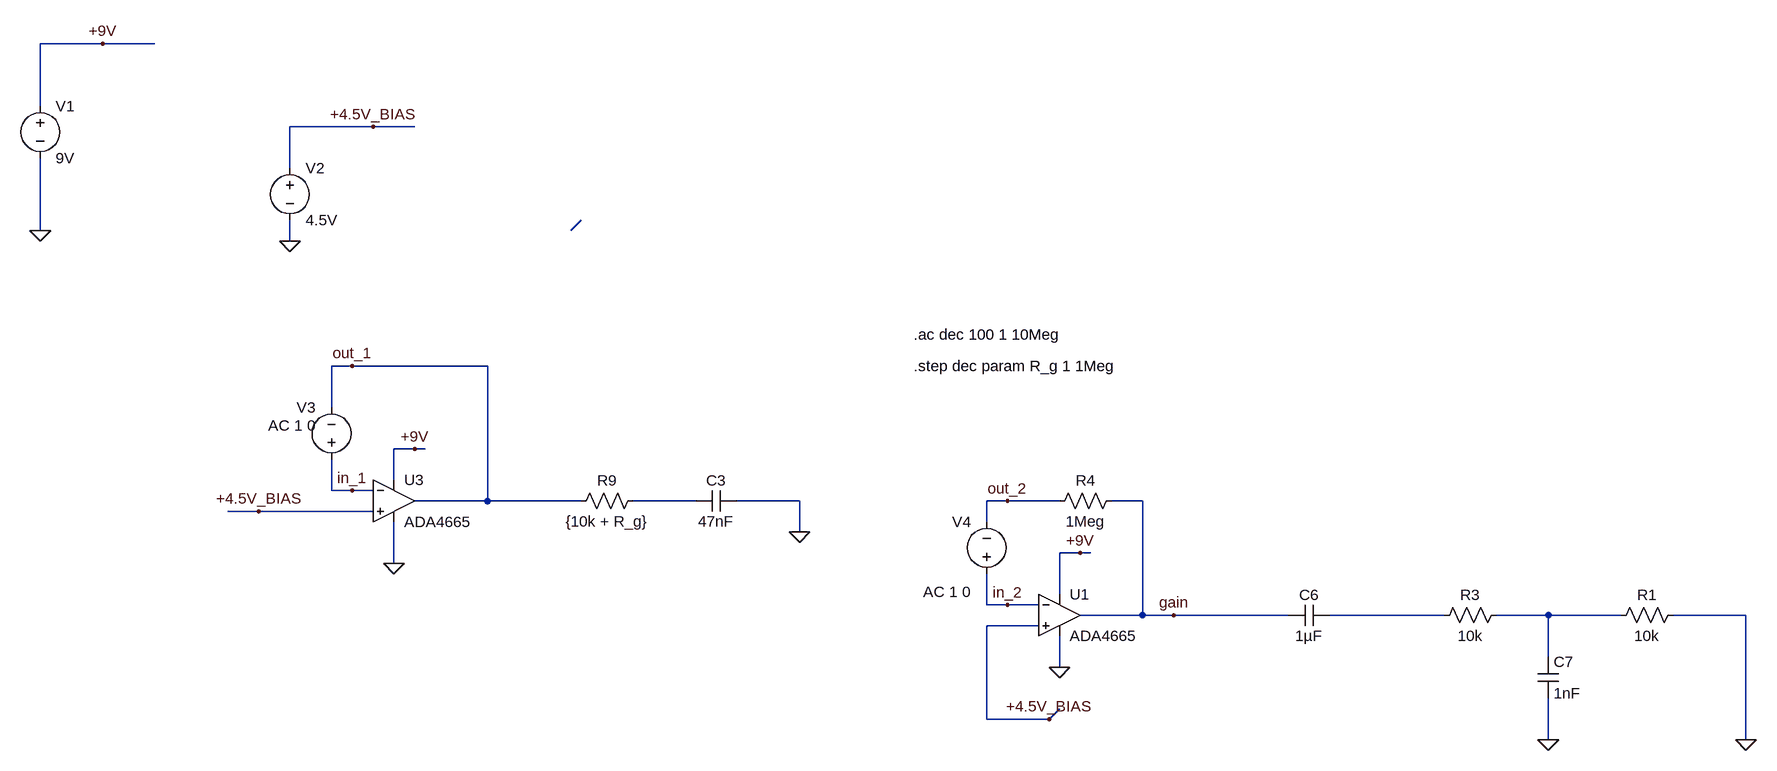
[diagram p0: schematic Distortion_Pedal_Stability_Modded.asc]
Distortion_Pedal_Stability_Modded.asc, the LTspice schematic file:
Version 4.1
SHEET 1 1732 680
WIRE -816 -576 -912 -576
WIRE -736 -576 -816 -576
WIRE -912 -480 -912 -576
WIRE -400 -448 -528 -448
WIRE -336 -448 -400 -448
WIRE -528 -384 -528 -448
WIRE -912 -288 -912 -400
WIRE -96 -288 -80 -304
WIRE -528 -272 -528 -304
WIRE -432 -80 -464 -80
WIRE -224 -80 -432 -80
WIRE -464 -16 -464 -80
WIRE -336 48 -368 48
WIRE -320 48 -336 48
WIRE -368 96 -368 48
WIRE -464 112 -464 64
WIRE -432 112 -464 112
WIRE -400 112 -432 112
WIRE -224 128 -224 -80
WIRE -224 128 -336 128
WIRE -80 128 -224 128
WIRE 96 128 0 128
WIRE 256 128 160 128
WIRE 576 128 544 128
WIRE 656 128 576 128
WIRE 784 128 736 128
WIRE -576 144 -624 144
WIRE -400 144 -576 144
WIRE 544 160 544 128
WIRE 256 176 256 128
WIRE 688 208 656 208
WIRE 704 208 688 208
WIRE -368 224 -368 160
WIRE 656 272 656 208
WIRE 544 288 544 240
WIRE 576 288 544 288
WIRE 624 288 576 288
WIRE 784 304 784 128
WIRE 784 304 688 304
WIRE 832 304 784 304
WIRE 1008 304 832 304
WIRE 1248 304 1072 304
WIRE 1408 304 1328 304
WIRE 1520 304 1408 304
WIRE 1712 304 1600 304
WIRE 624 320 544 320
WIRE 1408 368 1408 304
WIRE 656 384 656 336
WIRE 544 464 544 320
WIRE 640 464 656 448
WIRE 640 464 544 464
WIRE 1408 496 1408 432
WIRE 1712 496 1712 304
FLAG -912 -288 0
FLAG -816 -576 +9V
FLAG -400 -448 +4.5V_BIAS
FLAG 640 464 +4.5V_BIAS
FLAG 656 384 0
FLAG 688 208 +9V
FLAG 832 304 gain
FLAG 1408 496 0
FLAG -336 48 +9V
FLAG -368 224 0
FLAG -432 112 in_1
FLAG -432 -80 out_1
FLAG -528 -272 0
FLAG -576 144 +4.5V_BIAS
FLAG 256 176 0
FLAG 576 288 in_2
FLAG 576 128 out_2
FLAG 1712 496 0
SYMBOL voltage -912 -496 R0
SYMATTR InstName V1
SYMATTR Value 9V
SYMBOL res 752 112 R90
WINDOW 0 0 56 VBottom 2
WINDOW 3 32 56 VTop 2
SYMATTR InstName R4
SYMATTR Value 1Meg
SYMBOL res 16 112 R90
WINDOW 0 0 56 VBottom 2
WINDOW 3 32 56 VTop 2
SYMATTR InstName R9
SYMATTR Value {10k + R_g}
SYMBOL res 1232 320 R270
WINDOW 0 32 56 VTop 2
WINDOW 3 0 56 VBottom 2
SYMATTR InstName R3
SYMATTR Value 10k
SYMBOL cap 1072 288 R90
WINDOW 0 0 32 VBottom 2
WINDOW 3 32 32 VTop 2
SYMATTR InstName C6
SYMATTR Value 1µF
SYMBOL cap 1392 368 R0
SYMATTR InstName C7
SYMATTR Value 1nF
SYMBOL cap 160 112 R90
WINDOW 0 0 32 VBottom 2
WINDOW 3 32 32 VTop 2
SYMATTR InstName C3
SYMATTR Value 47nF
SYMBOL voltage -464 80 R180
WINDOW 0 24 96 Left 2
WINDOW 3 24 16 Left 2
WINDOW 123 24 68 Left 2
WINDOW 39 0 0 Left 0
SYMATTR InstName V3
SYMATTR Value ""
SYMATTR Value2 AC 1 0
SYMBOL voltage -528 -400 R0
SYMATTR InstName V2
SYMATTR Value 4.5V
SYMBOL voltage 544 256 R180
WINDOW 0 24 96 Left 2
WINDOW 3 24 16 Left 2
WINDOW 123 24 -12 Left 2
WINDOW 39 0 0 Left 0
SYMATTR InstName V4
SYMATTR Value ""
SYMATTR Value2 AC 1 0
SYMBOL OpAmps\\ADA4665 -368 64 R0
SYMATTR InstName U3
SYMBOL OpAmps\\ADA4665 656 240 R0
SYMATTR InstName U1
SYMBOL res 1616 288 R90
WINDOW 0 0 56 VBottom 2
WINDOW 3 32 56 VTop 2
SYMATTR InstName R1
SYMATTR Value 10k
TEXT 432 -128 Left 2 !.ac dec 100 1 10Meg
TEXT 432 -80 Left 2 !.step dec param R_g 1 1Meg

The netlist it stands for:
* Distortion_Pedal_Stability_Modded.asc
V1 +9V 0 9V
R4 gain out_2 1Meg
R9 N002 out_1 {10k + R_g}
R3 N003 N004 10k
C6 N003 gain 1µF
C7 N004 0 1nF
C3 0 N002 47nF
V3 in_1 out_1 AC 1 0
V2 +4.5V_BIAS 0 4.5V
V4 in_2 out_2 AC 1 0
X§U3 +4.5V_BIAS in_1 +9V 0 out_1 ADA4665  ; pins In+ In- V+ V- OUT
X§U1 +4.5V_BIAS in_2 +9V 0 gain ADA4665  ; pins In+ In- V+ V- OUT
R1 0 N004 10k
.ac dec 100 1 10Meg
.step dec param R_g 1 1Meg
.backanno
.end